# Altium schematic sheet ECG_Signal.SchDoc
size A3; SheetNumber: 2; SheetTotal: 2
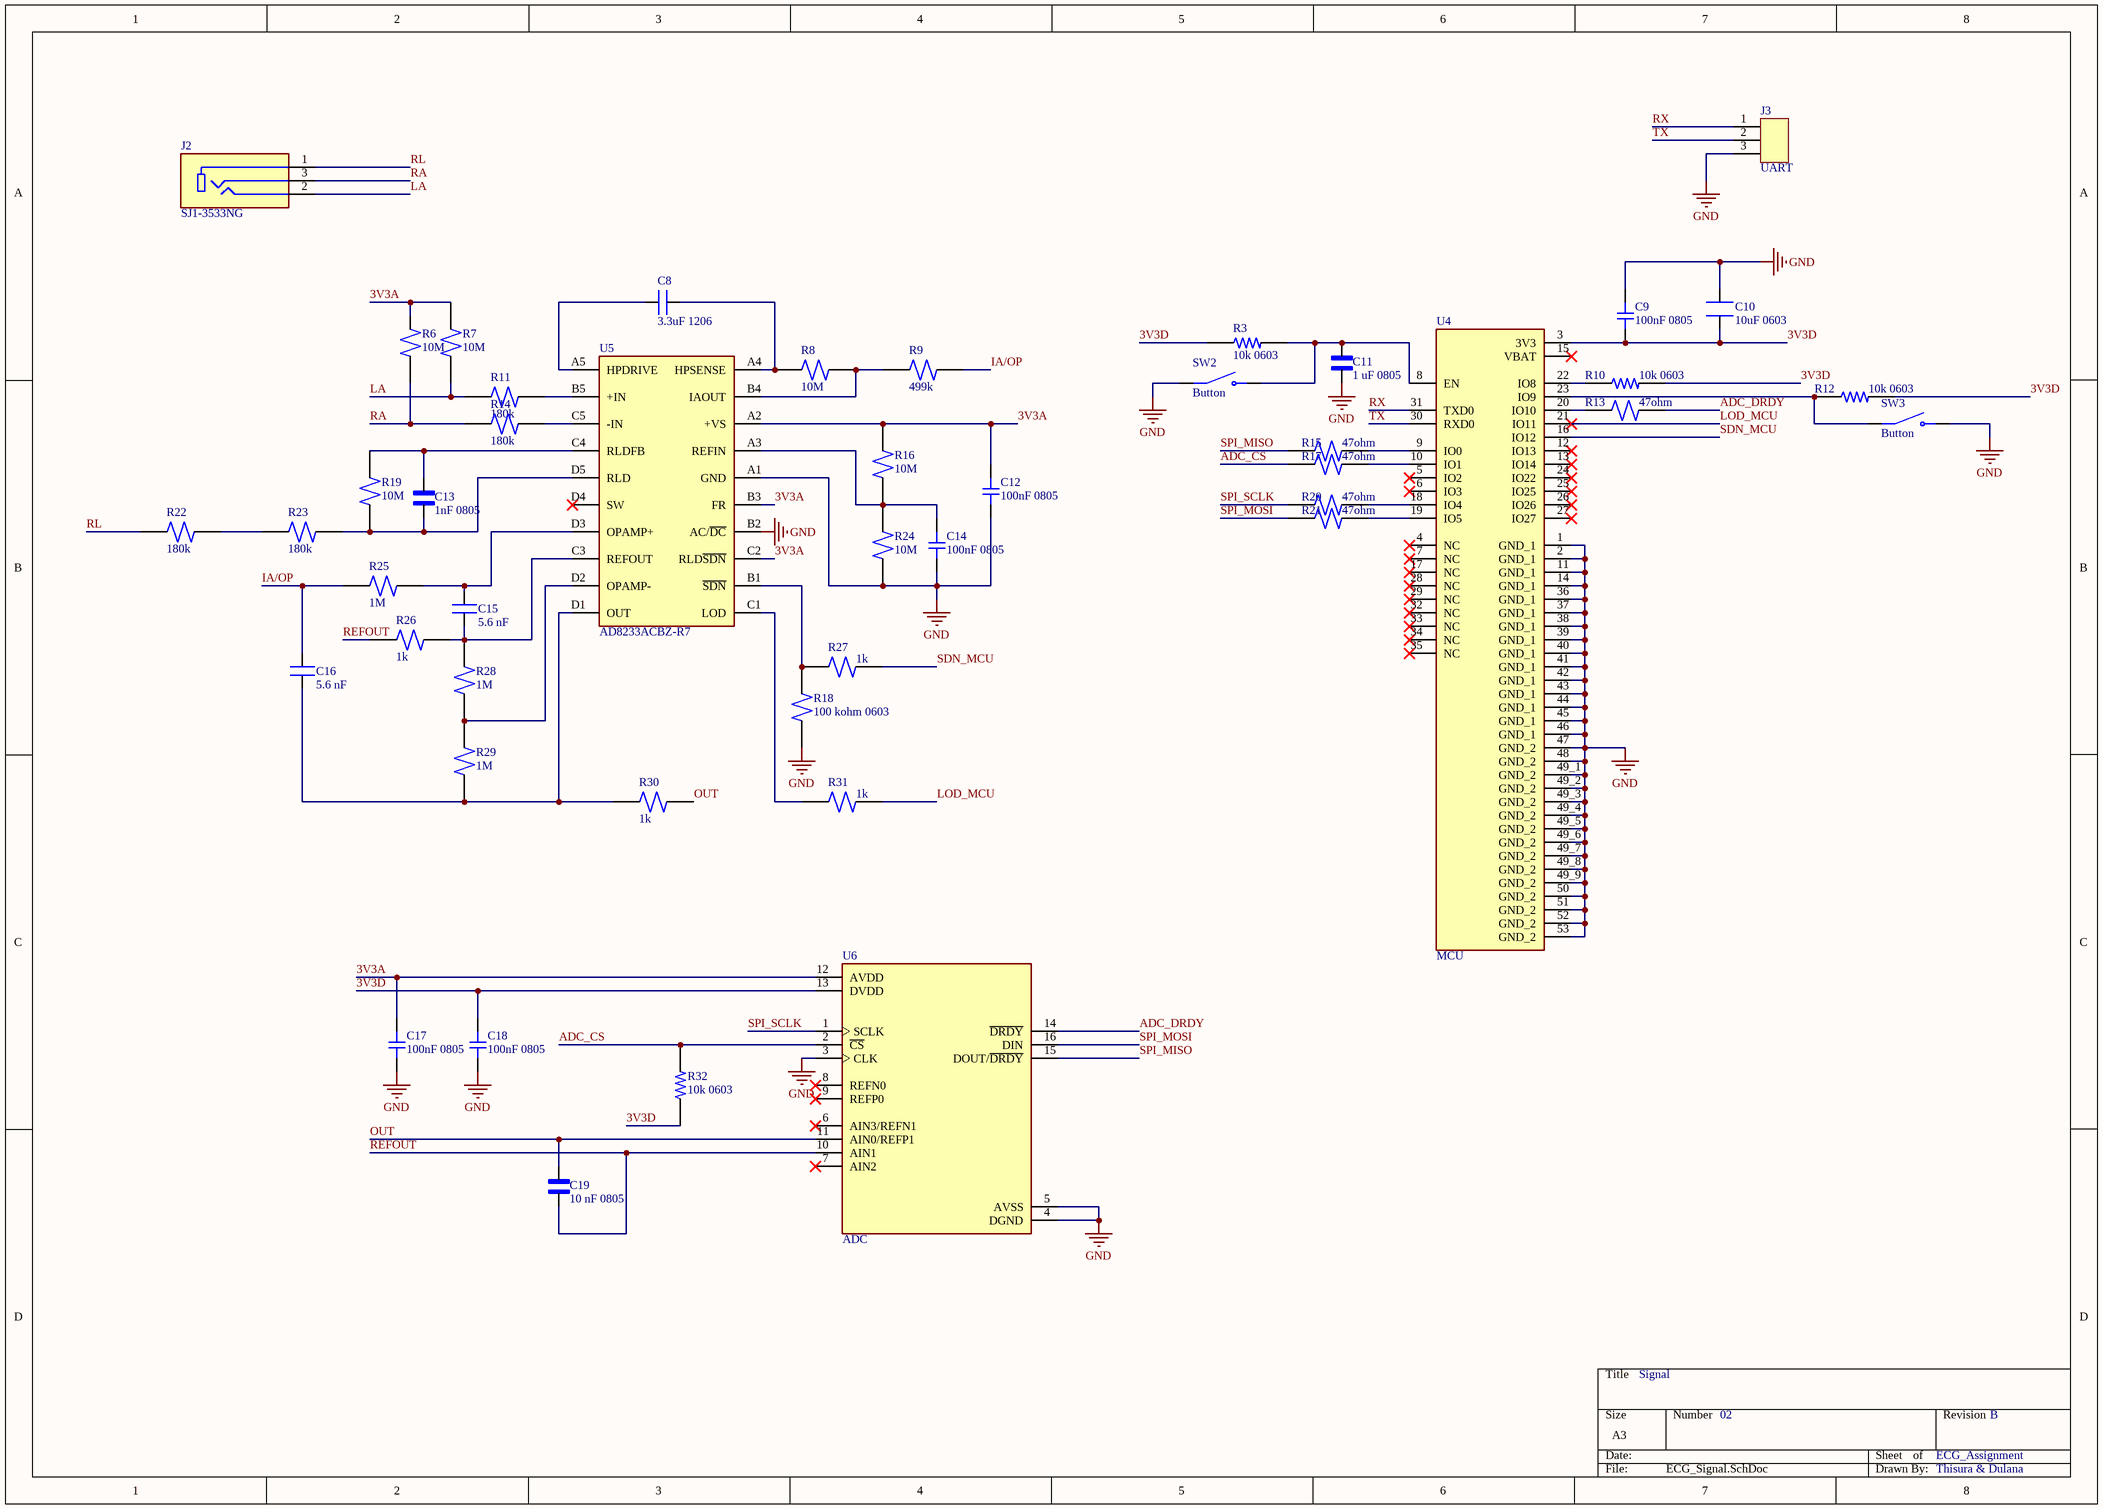
[diagram p0: ECG_Signal.SchDoc]

## Parts
C8  3.3uF 1206  [CAPC340180_180N_KEM]
C9  100nF 0805  [CAPC2012X88N]
C10  10uF 0603  [CAPC1608X100N]
C11  1 uF 0805  [CAPC2012X88N]
C12  100nF 0805  [CAPC2012X88N]
C13  1nF 0805  [CAPC2012X88N]
C14  100nF 0805  [CAPC2012X88N]
C15  5.6 nF  [CAPC220145_88N_KEM]
C16  5.6 nF  [CAPC220145_88N_KEM]
C17  100nF 0805  [CAPC2012X88N]
C18  100nF 0805  [CAPC2012X88N]
C19  10 nF 0805  [CAPC2012X140N]
J2  SJ1-3533NG  [CUI_SJ1-3533NG]
J3  UART  [CONN_PH1-03-UA_ADM]
R3  10k 0603  [RESC1607X60N]
R6  10M  [RESC2012X60N]
R7  10M  [RESC2012X60N]
R8  10M  [RESC2012X60N]
R9  499k  [RESC2012X60N]
R10  10k 0603  [RESC1607X60N]
R11  180k  [RESC2012X60N]
R12  10k 0603  [RESC1607X60N]
R13  47ohm  [RESC1005X35N]
R14  180k  [RESC2012X60N]
R15  47ohm  [RESC1005X35N]
R16  10M  [RESC2012X60N]
R17  47ohm  [RESC1005X35N]
R18  100 kohm 0603  [RESC1508X50N]
R19  10M  [RESC2012X60N]
R20  47ohm  [RESC1005X35N]
R21  47ohm  [RESC1005X35N]
R22  180k  [RESC2012X60N]
R23  180k  [RESC2012X60N]
R24  10M  [RESC2012X60N]
R25  1M  [RESC2012X60N]
R26  1k  [RESC2012X60N]
R27  1k  [RESC2012X60N]
R28  1M  [RESC2012X60N]
R29  1M  [RESC2012X60N]
R30  1k  [RESC2012X60N]
R31  1k  [RESC2012X60N]
R32  10k 0603  [RESC1607X60N]
SW2  Button  [SW_B3U-1000P]
SW3  Button  [SW_B3U-1000P]
U4  MCU  [MODULE_ESP32-H2-MINI-1-H2]
U5  AD8233ACBZ-R7  [BGA20N40P5X4_204X170X56N]
U6  ADC  [SOP65P640X120-16N]

## Nets
GND: C9.1(A) C10.2 C11.2 C12.2(B) C14.2(B) C17.1(A) C18.1(A) J3.3 R18.1 R24.1 SW2.1 SW3.2 U4.1(GND_1) U4.2(GND_1) U4.11(GND_1) U4.14(GND_1) U4.36(GND_1) U4.37(GND_1) U4.38(GND_1) U4.39(GND_1) U4.40(GND_1) U4.41(GND_1) U4.42(GND_1) U4.43(GND_1) U4.44(GND_1) U4.45(GND_1) U4.46(GND_1) U4.47(GND_2) U4.48(GND_2) U4.49_1(GND_2) U4.49_2(GND_2) U4.49_3(GND_2) U4.49_4(GND_2) U4.49_5(GND_2) U4.49_6(GND_2) U4.49_7(GND_2) U4.49_8(GND_2) U4.49_9(GND_2) U4.50(GND_2) U4.51(GND_2) U4.52(GND_2) U4.53(GND_2) U5.A1(GND) U5.B2(AC/~{DC}) U6.3(CLK) U6.4(DGND) U6.5(AVSS)
3V3A: C12.1(A) C17.2(B) R6.2 R7.2 R16.2 U5.A2(+VS) U5.B3(FR) U5.C2(RLD~{SDN}) U6.12(AVDD)
3V3D: C9.2(B) C10.1 C18.2(B) R3.1 R10.2 R12.2 R32.1 U4.3(3V3) U6.13(DVDD)
ADC_CS: R17.1 R32.2 U6.2(~{CS})
ADC_DRDY: R13.2 U6.14(~{DRDY})
IA/OP: C16.1 R9.2 R25.1
LA: J2.2 R7.1 R11.1
LOD_MCU: R31.2 U4.21(IO11)
OUT: C19.2 R30.2 U6.11(AIN0/REFP1)
RA: J2.3 R6.1 R14.1
REFOUT: C19.1 R26.1 U6.10(AIN1)
RL: J2.1 R22.1
RX: J3.1 U4.31(TXD0)
SDN_MCU: R27.2 U4.16(IO12)
SPI_MISO: R15.1 U6.15(DOUT/~{DRDY})
SPI_MOSI: R21.1 U6.16(DIN)
SPI_SCLK: R20.1 U6.1(SCLK)
TX: J3.2 U4.30(RXD0)
NetC8_1: C8.1 U5.A5(HPDRIVE)
NetC8_2: C8.2 R8.1 U5.A4(HPSENSE)
NetC11_1: C11.1 R3.2 SW2.2 U4.8(EN)
NetC13_1: C13.1 R19.1 R23.2 U5.D5(RLD)
NetC13_2: C13.2 R19.2 U5.C4(RLDFB)
NetC14_1: C14.1(A) R16.1 R24.2 U5.A3(REFIN)
NetC15_1: C15.1 R26.2 R28.2 U5.C3(REFOUT)
NetC15_2: C15.2 R25.2 U5.D3(OPAMP+)
NetC16_2: C16.2 R29.1 R30.1 U5.D1(OUT)
NetR8_2: R8.2 R9.1 U5.B4(IAOUT)
NetR10_1: R10.1 U4.22(IO8)
NetR11_2: R11.2 U5.B5(+IN)
NetR12_1: R12.1 SW3.1 U4.23(IO9)
NetR13_1: R13.1 U4.20(IO10)
NetR14_2: R14.2 U5.C5(-IN)
NetR15_2: R15.2 U4.9(IO0)
NetR17_2: R17.2 U4.10(IO1)
NetR18_2: R18.2 R27.1 U5.B1(~{SDN})
NetR20_2: R20.2 U4.18(IO4)
NetR21_2: R21.2 U4.19(IO5)
NetR22_2: R22.2 R23.1
NetR28_1: R28.1 R29.2 U5.D2(OPAMP-)
NetR31_1: R31.1 U5.C1(LOD)

Not connected (* = marked no-connect by the designer): U4 4(NC)* 5(IO2)* 6(IO3)* 7(NC)* 12(IO13)* 13(IO14)* 15(VBAT)* 17(NC)* 24(IO22)* 25(IO25)* 26(IO26)* 27(IO27)* 28(NC)* 29(NC)* 32(NC)* 33(NC)* 34(NC)* 35(NC)*; U5 D4(SW)*; U6 6(AIN3/REFN1)* 7(AIN2)* 8(REFN0)* 9(REFP0)*

## Notes on the sheet
- Signal
- 02
- ECG_Assignment
- B
- Thisura & Dulana

## Library data of the parts
C8 = C1206C335K3RACTU: SMD Comm X7R, Ceramic, 3.3 uF, 10%, 25 VDC, X7R, SMD, MLCC, Temperature Stable, Class II, 1206; Manufacturer_Name: Kemet; Copyright: Copyright (C) 2026 Ultra Librarian. All rights reserved.; Manufacturer_Part_Number: C1206C335K3RACTU; Datasheet: https://content.kemet.com/datasheets/KEM_C1002_X7R_SMD.pdf
C9 C12 C14 C17 C18 = C0805C104K5RACTU: Capacitor, Ceramic, Cap, .100uF, Tol 10%, SMT, 50V, X7R, Tape/Reel | KEMET C0805C104K5RACTU; SnapEDA_Link: https://www.snapeda.com/parts/C0805C104K5RACTU/KEMET/view-part/?ref=snap; Package: Package; Value: *; MF: KEMET; MP: C0805C104K5RACTU; Check_prices: https://www.snapeda.com/parts/C0805C104K5RACTU/KEMET/view-part/?ref=eda
C10 = MSAST168BB5106MTNA01: 10uF 25V 20% Multilayer Ceramic Capacitor X5R 0603 (1608 Metric); MANUFACTURER: Taiyo Yuden; MAXIMUM_PACKAGE_HEIGHT: 1.00mm; Package: 1608-2 TAIYO; MPN: MSAST168BB5106MTNA01; Value: *; SOURCE_URL: https://www.snapeda.com/parts/MSAST168BB5106MTNA01/Taiyo+Yuden/view-part/; DATASHEET_URL: https://snapeda.s3.amazonaws.com/datasheet/Taiyo_Yuden_MLCC_S.pdf; STANDARD: IPC-7351B
C11 = C0805C105K4RACTU: Capacitor,Ceramic,Cap 1 uF,Tol 10%,Vol-Rtg 16 VDC,SMT,0805,X7R,Tape & Reel | KEMET C0805C105K4RACTU; SnapEDA_Link: https://www.snapeda.com/parts/C0805C105K4RACTU/KEMET/view-part/?ref=snap; Package: 805-2 KEMET; Value: *; MF: KEMET; MP: C0805C105K4RACTU; Check_prices: https://www.snapeda.com/parts/C0805C105K4RACTU/KEMET/view-part/?ref=eda
C13 = C0805C102J5GACTU: CAP, 1000PF, 50V, 5%, C0G/NP0, 0805; Capacitance:1000pF; Voltage Rating:50V; Ceramic Capacitor Case:0805 [2012 Metric]; Capacitance Tolerance:Â± 5%; Dielectric Characteristic:C0G / NP0; Product Range:C Series KEMET; Opera; MP: C0805C102J5GAC-TU; SnapEDA_Link: https://www.snapeda.com/parts/C0805C102J5GAC-TU/Kemet/view-part/?ref=snap; Package: Package; Value: *; MF: KEMET; Check_prices: https://www.snapeda.com/parts/C0805C102J5GAC-TU/Kemet/view-part/?ref=eda
C15 C16 = C0805C562J5GACTU: SMD Comm C0G, Ceramic, 5600 pF, 5%, 50 VDC, C0G, SMD, MLCC, Ultra-Stable, Low Loss, Class I, 0805; Manufacturer_Name: Kemet; Copyright: Copyright (C) 2025 Ultra Librarian. All rights reserved.; Manufacturer_Part_Number: C0805C562J5GACTU
C19 = C0805C103J5GACTU: 0805 C 10nF Ceramic Multilayer Capacitor, 50 V, +125degC, C0G Dielectric, +/-5% | KEMET C0805C103J5GACTU; SnapEDA_Link: https://www.snapeda.com/parts/C0805C103J5GACTU/KEMET/view-part/?ref=snap; Package: 0805 Kemet; Value: *; MF: KEMET; MP: C0805C103J5GACTU; Check_prices: https://www.snapeda.com/parts/C0805C103J5GACTU/KEMET/view-part/?ref=eda
J2 = SJ1-3533NG: 3.5 mm Right-Angle Stereo Jack, 3 Pin PCB Mount, Isolated Ground; MF: Same Sky; SnapEDA_Link: https://www.snapeda.com/parts/SJ1-3533NG/Same+Sky/view-part/?ref=snap; Package: None; Value: *; MP: SJ1-3533NG; Check_prices: https://www.snapeda.com/parts/SJ1-3533NG/Same+Sky/view-part/?ref=eda
J3 = PH1-03-UA: Description; Manufacturer_Name: ADAM TECHNOLOGIES INC; Copyright: Copyright (C) 2025 Ultra Librarian. All rights reserved.; Manufacturer_Part_Number: PH1-03-UA; RefDes: RefDes; Type: Type
R3 R10 R12 R32 = RC0603FR-0710KL: 10 kOhms Â±1% 0.1W, 1/10W Chip Resistor 0603 (1608 Metric) Moisture Resistant Thick Film; MF: Yageo; SnapEDA_Link: https://www.snapeda.com/parts/RC0603FR-0710KL/Yageo/view-part/?ref=snap; Package: 0603 Yageo; Value: *; MP: RC0603FR-0710KL; Check_prices: https://www.snapeda.com/parts/RC0603FR-0710KL/Yageo/view-part/?ref=eda
R6-R8 R16 R19 R24 = RC0805FR-0710ML: 10 MOhms Â±1% 0.125W, 1/8W Chip Resistor 0805 (2012 Metric) Moisture Resistant Thick Film; MF: Yageo; SnapEDA_Link: https://www.snapeda.com/parts/RC0805FR-0710ML/Yageo/view-part/?ref=snap; Package: 2012 Yageo; Value: *; MP: RC0805FR-0710ML; Check_prices: https://www.snapeda.com/parts/RC0805FR-0710ML/Yageo/view-part/?ref=eda
R9 = RC0805FR-07499KL: 0805 (2012 mÃ©trico), 499 kOhms Â±1%, 0,125 W, 1/8 W, pelÃ­cula gruesa resistente a la humedad; MF: Yageo; SnapEDA_Link: https://www.snapeda.com/parts/RC0805FR-07499KL/Yageo/view-part/?ref=snap; Package: 2012 Yageo; Value: *; MP: RC0805FR-07499KL; Check_prices: https://www.snapeda.com/parts/RC0805FR-07499KL/Yageo/view-part/?ref=eda
R11 R14 R22 R23 = RC0805FR-07180KL: 180 kOhms Â±1% 0.125W, 1/8W Chip Resistor 0805 (2012 Metric) Moisture Resistant Thick Film; MF: Yageo; SnapEDA_Link: https://www.snapeda.com/parts/RC0805FR-07180KL/Yageo/view-part/?ref=snap; Package: 2012 Yageo; Value: *; MP: RC0805FR-07180KL; Check_prices: https://www.snapeda.com/parts/RC0805FR-07180KL/Yageo/view-part/?ref=eda
R13 R15 R17 R20 R21 = RMCF0402JT47R0: 47 Ohms Â±5% 0.063W, 1/16W Chip Resistor 0402 (1005 Metric) Automotive AEC-Q200 Thick Film; MF: Stackpole Electronics Inc; SnapEDA_Link: https://www.snapeda.com/parts/RMCF0402JT47R0/Stackpole+Electronics/view-part/?ref=snap; Package: 1005 Stackpole; Value: *; MP: RMCF0402JT47R0; Check_prices: https://www.snapeda.com/parts/RMCF0402JT47R0/Stackpole+Electronics/view-part/?ref=eda
R18 = CRCW0603100KFKEA: Resistor, Thick Film, 100 Kilohms, 0.1W, 1%, SMT, TCR 37 ppm/DegC, Tape and Reel | Vishay Dale CRCW0603100KFKEA; SnapEDA_Link: https://www.snapeda.com/parts/CRCW0603100KFKEA/Vishay+Dale/view-part/?ref=snap; Package: 1508 Vishay; Value: *; MF: Vishay; MP: CRCW0603100KFKEA; Check_prices: https://www.snapeda.com/parts/CRCW0603100KFKEA/Vishay+Dale/view-part/?ref=eda
R25 R28 R29 = RC0805FR-071ML: 1 MOhms Â±1% 0.125W, 1/8W Chip Resistor 0805 (2012 Metric) Moisture Resistant Thick Film; MF: Yageo; SnapEDA_Link: https://www.snapeda.com/parts/RC0805FR-071ML/Yageo/view-part/?ref=snap; Package: 2012 Yageo; Value: *; MP: RC0805FR-071ML; Check_prices: https://www.snapeda.com/parts/RC0805FR-071ML/Yageo/view-part/?ref=eda
R26 R27 R30 R31 = RC0805FR-071KL: 1 kOhms Â±1% 0.125W, 1/8W Chip Resistor 0805 (2012 Metric) Moisture Resistant Thick Film; MF: Yageo; DigiKey_Part_Number: 311-1.00KCRTR-ND; Purchase-URL: https://pricing.snapeda.com/search?q=RC0805FR-071KL&ref=eda; Package: 2012 Yageo; Check_prices: https://www.snapeda.com/parts/RC0805FR-071KL/Yageo/view-part/?ref=eda; Value: *; SnapEDA_Link: https://www.snapeda.com/parts/RC0805FR-071KL/Yageo/view-part/?ref=snap; MP: RC0805FR-071KL
SW2 SW3 = B3U-1000P: Switch Tactile N.O. SPST Round Button Gull Wing 0.05A 12VDC 1.5N SMD Embossed T/R; Price: None; MP: B3U-1000P; Availability: Unavailable; Value: *; Package: None
U4 = ESP32-H2-MINI-1-H2: 802.15.4, Bluetooth Bluetooth v5.3, ZigbeeÂ® Transceiver Module 2.4GHz Integrated, Trace Surface Mount; MF: Espressif Systems; SnapEDA_Link: https://www.snapeda.com/parts/ESP32-H2-MINI-1-H2/Espressif+Systems/view-part/?ref=snap; Package: SMD-53 Espressif Systems; Value: *; MP: ESP32-H2-MINI-1-H2; Check_prices: https://www.snapeda.com/parts/ESP32-H2-MINI-1-H2/Espressif+Systems/view-part/?ref=eda
U5 = AD8233ACBZ-R7: 50 Î¼A, 2 mm Ã— 1.7 mm WLCSP, Low Noise, Heart Rate Monitor for Wearable Products; MF: Analog Devices; SnapEDA_Link: https://www.snapeda.com/parts/AD8233ACBZ-R7/Analog+Devices/view-part/?ref=snap; Package: WLCSP -20 Analog Devices; Value: *; MP: AD8233ACBZ-R7; Check_prices: https://www.snapeda.com/parts/AD8233ACBZ-R7/Analog+Devices/view-part/?ref=eda
U6 = ADS1220IPWR: 24-bit, 2-kSPS, four-channel, low-power, delta-sigma ADC with PGA, VREF, SPI and two IDACs; MF: Texas Instruments; SnapEDA_Link: https://www.snapeda.com/parts/ADS1220IPWR/Texas+Instruments/view-part/?ref=snap; Package: TSSOP-16 Texas Instruments; Value: *; MP: ADS1220IPWR; Check_prices: https://www.snapeda.com/parts/ADS1220IPWR/Texas+Instruments/view-part/?ref=eda